# EasyEDA Pro project StepMother1_EasyEDA-Pro-V2_2026-11-01.epro

# Schematic Schematic1
Board Name: Board1; Create Date: 2026-08-29; Page Name: P1; Project Name: Step Sequencer; Schematic Name: Schematic1; Update Date: 2026-08-29; Company: EasyEDA.com; Page Size: A4; Version: V1.0
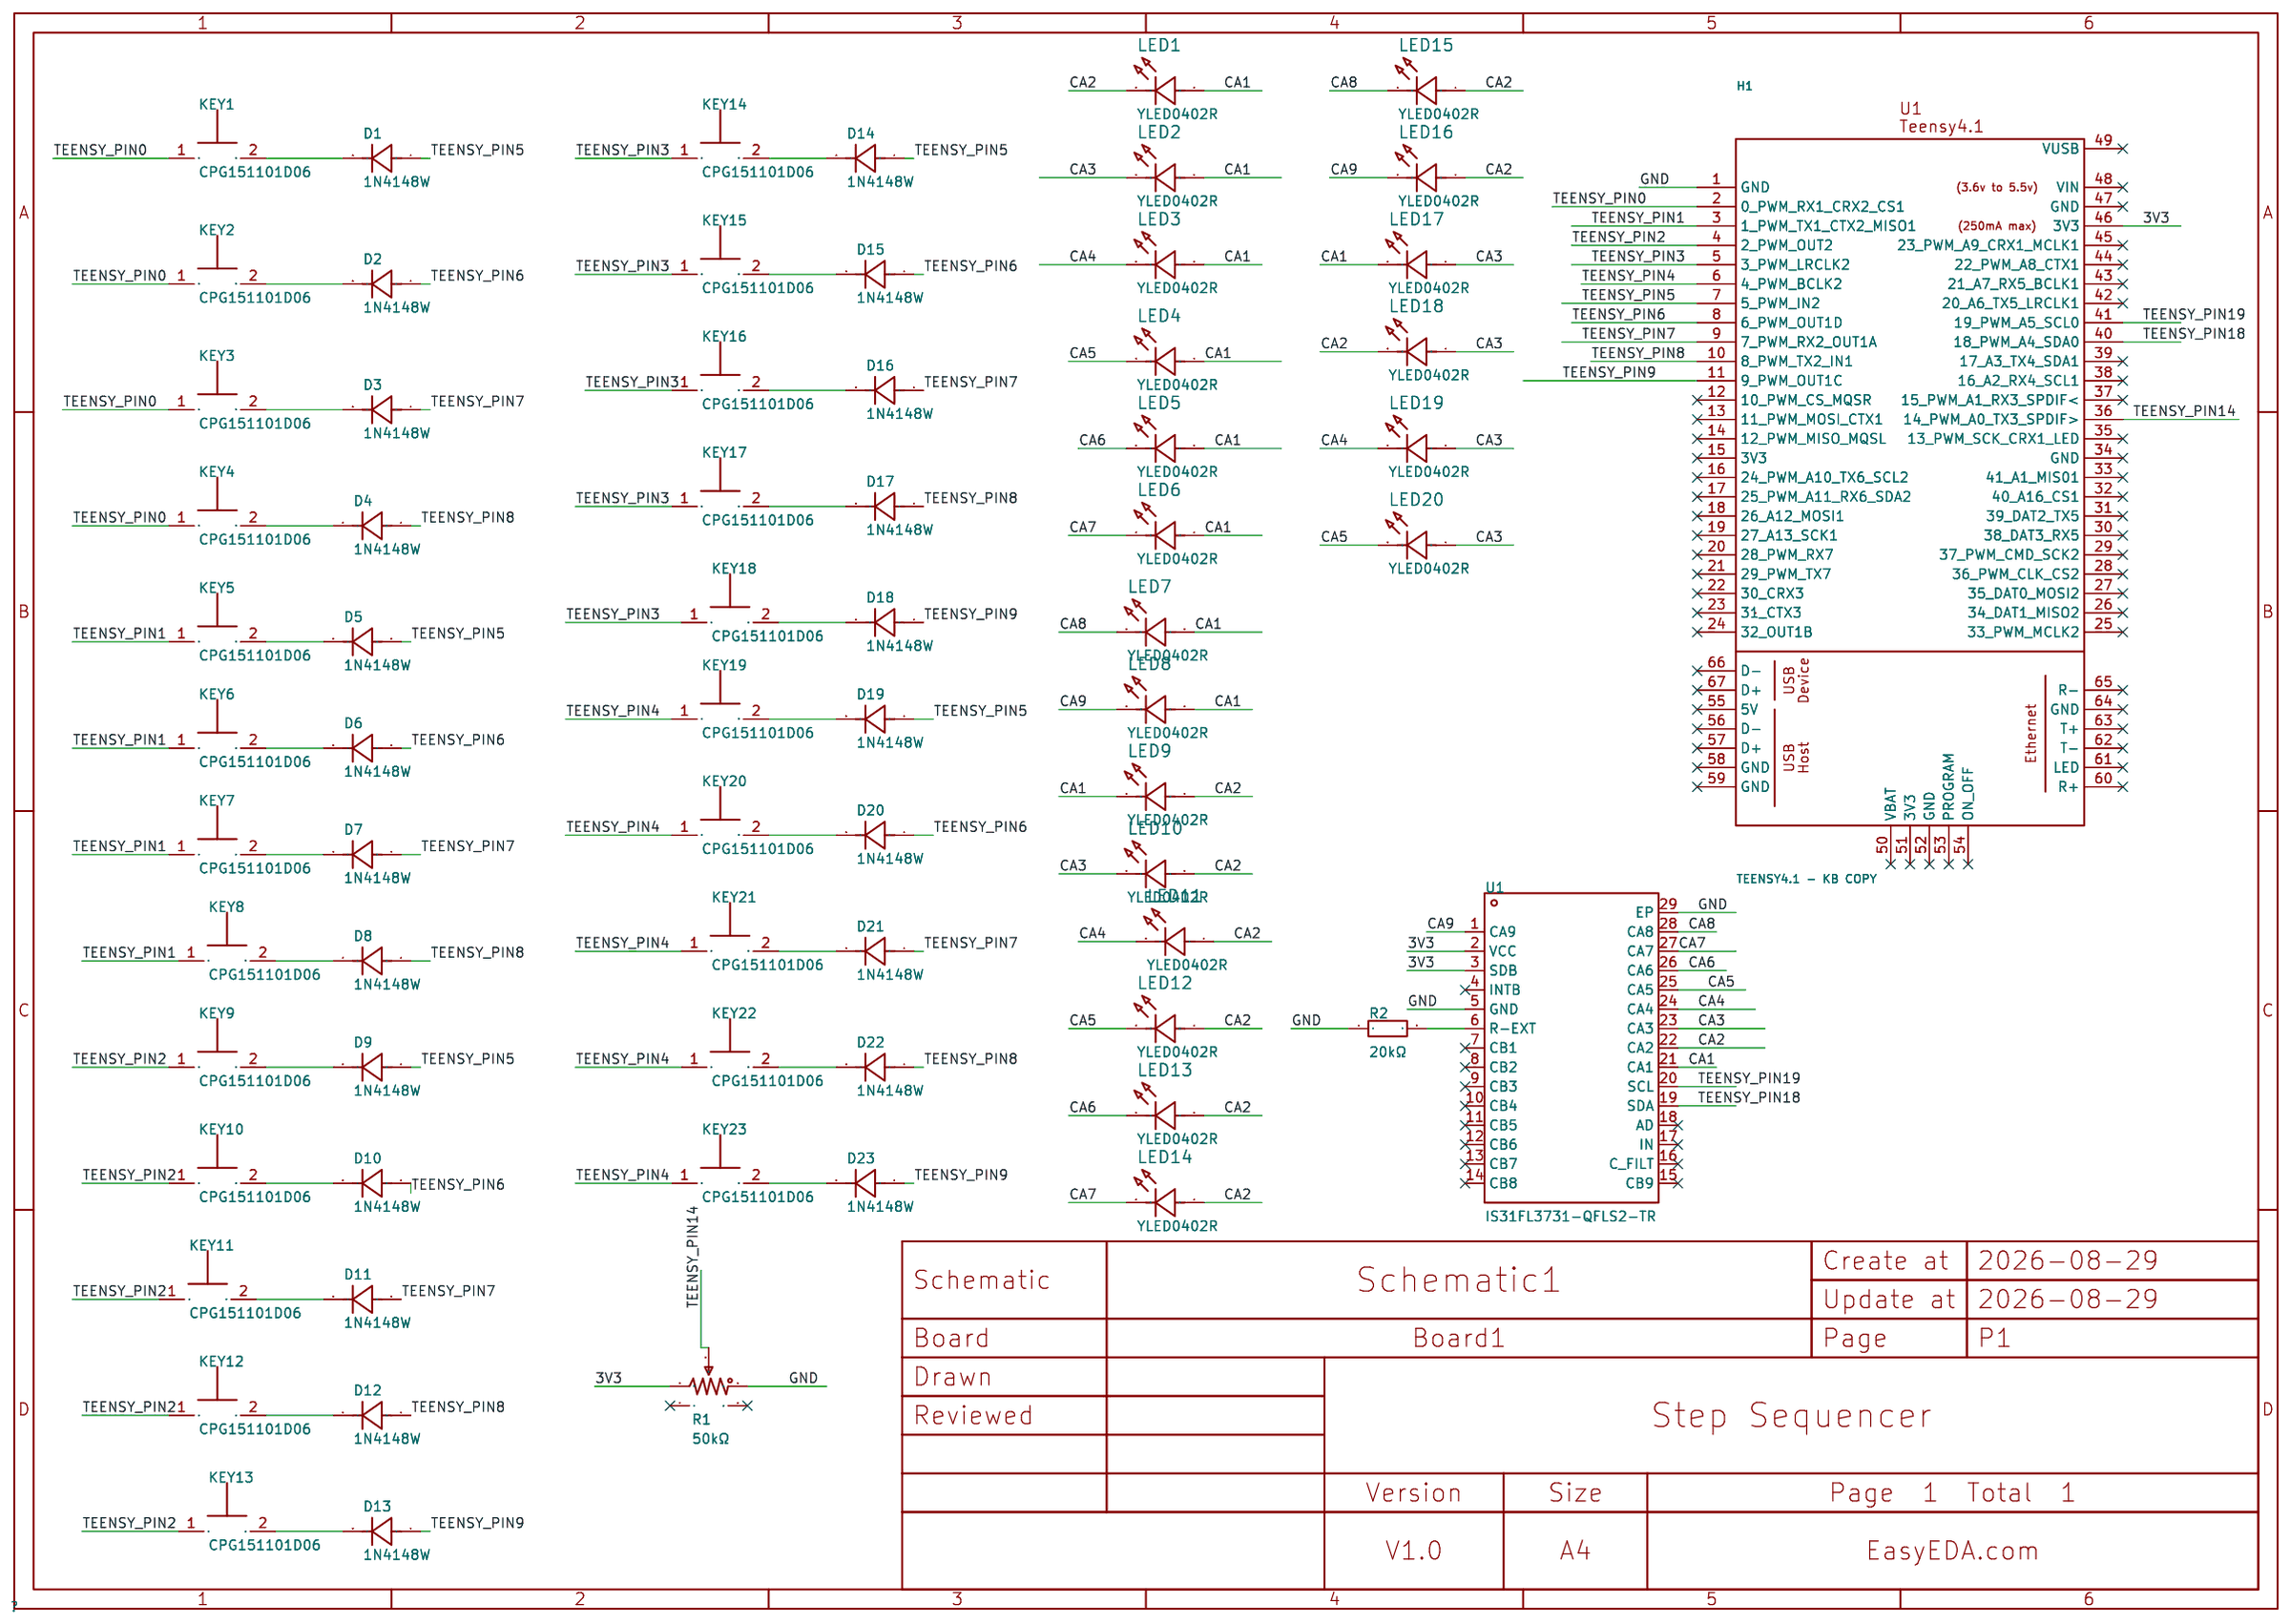
[diagram p0: schematic sheet]

## Parts
D1  1N4148W  [SOD-123_L2.7-W1.6-LS3.7-FD]
D2  1N4148W  [SOD-123_L2.7-W1.6-LS3.7-FD]
D3  1N4148W  [SOD-123_L2.7-W1.6-LS3.7-FD]
D4  1N4148W  [SOD-123_L2.7-W1.6-LS3.7-FD]
D5  1N4148W  [SOD-123_L2.7-W1.6-LS3.7-FD]
D6  1N4148W  [SOD-123_L2.7-W1.6-LS3.7-FD]
D7  1N4148W  [SOD-123_L2.7-W1.6-LS3.7-FD]
D8  1N4148W  [SOD-123_L2.7-W1.6-LS3.7-FD]
D9  1N4148W  [SOD-123_L2.7-W1.6-LS3.7-FD]
D10  1N4148W  [SOD-123_L2.7-W1.6-LS3.7-FD]
D11  1N4148W  [SOD-123_L2.7-W1.6-LS3.7-FD]
D12  1N4148W  [SOD-123_L2.7-W1.6-LS3.7-FD]
D13  1N4148W  [SOD-123_L2.7-W1.6-LS3.7-FD]
D14  1N4148W  [SOD-123_L2.7-W1.6-LS3.7-FD]
D15  1N4148W  [SOD-123_L2.7-W1.6-LS3.7-FD]
D16  1N4148W  [SOD-123_L2.7-W1.6-LS3.7-FD]
D17  1N4148W  [SOD-123_L2.7-W1.6-LS3.7-FD]
D18  1N4148W  [SOD-123_L2.7-W1.6-LS3.7-FD]
D19  1N4148W  [SOD-123_L2.7-W1.6-LS3.7-FD]
D20  1N4148W  [SOD-123_L2.7-W1.6-LS3.7-FD]
D21  1N4148W  [SOD-123_L2.7-W1.6-LS3.7-FD]
D22  1N4148W  [SOD-123_L2.7-W1.6-LS3.7-FD]
D23  1N4148W  [SOD-123_L2.7-W1.6-LS3.7-FD]
H1  Teensy 4.1  [TEENSY4.1 - KB]
KEY1  CPG151101D06  [KEY-TH_CPG151101D06]
KEY2  CPG151101D06  [KEY-TH_CPG151101D06]
KEY3  CPG151101D06  [KEY-TH_CPG151101D06]
KEY4  CPG151101D06  [KEY-TH_CPG151101D06]
KEY5  CPG151101D06  [KEY-TH_CPG151101D06]
KEY6  CPG151101D06  [KEY-TH_CPG151101D06]
KEY7  CPG151101D06  [KEY-TH_CPG151101D06]
KEY8  CPG151101D06  [KEY-TH_CPG151101D06]
KEY9  CPG151101D06  [KEY-TH_CPG151101D06]
KEY10  CPG151101D06  [KEY-TH_CPG151101D06]
KEY11  CPG151101D06  [KEY-TH_CPG151101D06]
KEY12  CPG151101D06  [KEY-TH_CPG151101D06]
KEY13  CPG151101D06  [KEY-TH_CPG151101D06]
KEY14  CPG151101D06  [KEY-TH_CPG151101D06]
KEY15  CPG151101D06  [KEY-TH_CPG151101D06]
KEY16  CPG151101D06  [KEY-TH_CPG151101D06]
KEY17  CPG151101D06  [KEY-TH_CPG151101D06]
KEY18  CPG151101D06  [KEY-TH_CPG151101D06]
KEY19  CPG151101D06  [KEY-TH_CPG151101D06]
KEY20  CPG151101D06  [KEY-TH_CPG151101D06]
KEY21  CPG151101D06  [KEY-TH_CPG151101D06]
KEY22  CPG151101D06  [KEY-TH_CPG151101D06]
KEY23  CPG151101D06  [KEY-TH_CPG151101D06]
LED1  YLED0402R  [LED0402-R-RD]
LED2  YLED0402R  [LED0402-R-RD]
LED3  YLED0402R  [LED0402-R-RD]
LED4  YLED0402R  [LED0402-R-RD]
LED5  YLED0402R  [LED0402-R-RD]
LED6  YLED0402R  [LED0402-R-RD]
LED7  YLED0402R  [LED0402-R-RD]
LED8  YLED0402R  [LED0402-R-RD]
LED9  YLED0402R  [LED0402-R-RD]
LED10  YLED0402R  [LED0402-R-RD]
LED11  YLED0402R  [LED0402-R-RD]
LED12  YLED0402R  [LED0402-R-RD]
LED13  YLED0402R  [LED0402-R-RD]
LED14  YLED0402R  [LED0402-R-RD]
LED15  YLED0402R  [LED0402-R-RD]
LED16  YLED0402R  [LED0402-R-RD]
LED17  YLED0402R  [LED0402-R-RD]
LED18  YLED0402R  [LED0402-R-RD]
LED19  YLED0402R  [LED0402-R-RD]
LED20  YLED0402R  [LED0402-R-RD]
R1  50kΩ  [RES-ADJ-TH_RK09L1140A5P]
R2  20kΩ  [R0603]
U1  IS31FL3731-QFLS2-TR  [QFN-28_L4.0-W4.0-P0.40-BL-EP]

## Library data of the parts
D1-D23 = 1N4148W_C5345962: Diode Configuration:Standalone Pd - Power Dissipation:350mW Current - Rectified:150mA Voltage - DC Reverse(Vr):100V Voltage - Forward(Vf@If):1.25V@150mA Non-Repetitive Peak Forward Surge Current:2A Reverse Leakage Current (Ir):1uA@75V Reverse Recovery Tim; LCSC Part Name: 100V 150mA; Supplier Part: C5345962; Manufacturer: HXY MOSFET(华轩阳电子); Supplier Footprint: SOD-123; JLCPCB Part Class: Extended Part; Datasheet: https://item.szlcsc.com/datasheet/1N4148W/6125799.html; Supplier: LCSC; Diode Configuration: Standalone; Pd - Power Dissipation: 350mW; Current - Rectified: 150mA; Voltage - DC Reverse(Vr): 100V; Voltage - Forward(Vf@If): 1.25V@150mA; Non-Repetitive Peak Forward Surge Current: 2A; Reverse Leakage Current (Ir): 1uA@75V; Reverse Recovery Time (trr): 4ns; Operating Junction Temperature Range: -55℃~+150℃
H1 = TEENSY4.1 - KB COPY: Manufacturer: PJRC; Manufacturer Part: Teensy4.1; link: https://www.pjrc.com/store/teensy41.html
KEY1-KEY23 = CPG151101D06: Axis Type:Brown Switch Operation Force:45gf Conduction Travel:2mm Voltage Rating:12V Operating Temperature:-40℃~+70℃ Operating Temperature:-40℃~+70℃; LCSC Part Name: 茶轴; Supplier Part: C49234237; Manufacturer: HanElectricity(瀚源); Supplier Footprint: 插件; JLCPCB Part Class: Extended Part; Datasheet: https://item.szlcsc.com/datasheet/CPG151101D06/51650379.html; Supplier: LCSC; Axis Type: Brown Switch; Operation Force: 45gf; Conduction Travel: 2mm; Voltage Rating: 12V; Operating Temperature: -40℃~+70℃
LED1-LED20 = YLED0402R: Lamp Holder Type:- Illumination Color:Red Voltage - Forward(Vf):1.8V~2.4V Voltage - Forward(Vf):1.8V~2.4V Power(Watts):60mW Forward Current:20mA Wavelength - Dominant:615nm~630nm Wavelength - Dominant:615nm~630nm Peak Wavelength:645nm Peak Wavelength:645n; LCSC Part Name: 发光管; Supplier Part: C21260817; Manufacturer: YONGYUTAI(永裕泰); Supplier Footprint: 0402; JLCPCB Part Class: Extended Part; Datasheet: https://item.szlcsc.com/datasheet/YLED0402R/22678288.html; Supplier: LCSC; Illumination Color: Red; Voltage - Forward(Vf): 1.8V~2.4V; Power(Watts): 60mW; Forward Current: 20mA; Wavelength - Dominant: 615nm~630nm; Peak Wavelength: 645nm; Diode Configuration: Discrete Diode; Lens Color: Water Clear; Luminous Intensity: 250mcd; Viewing Angle: 120°; Operating Temperature: -40℃~+85℃
R1 = RK09L1140A5P: Resistance:50kΩ Tolerance:±20% Tolerance:±20% Voltage Rating:10V Power(Watts):50mW; LCSC Part Name: 三件套 50kΩ ±20%; Supplier Part: C231764; Manufacturer: ALPSALPINE(阿尔卑斯阿尔派); Supplier Footprint: 插件; JLCPCB Part Class: Extended Part; Datasheet: https://item.szlcsc.com/datasheet/RK09L1140A5P/231612.html; Supplier: LCSC; Tolerance: ±20%; Voltage Rating: 10V; Power(Watts): 50mW
R2 = 0603WAF2002T5E: Type:Thick Film Resistor Resistance:20kΩ Tolerance:±1% Tolerance:±1% Power(Watts):100mW Voltage-Supply(Max):75V Temperature Coefficient:±100ppm/℃ Temperature Coefficient:±100ppm/℃ Operating Temperature:-55℃~+155℃ Operating Temperature:-55℃~+155℃; LCSC Part Name: 厚膜电阻 20kΩ ±1%; Supplier Part: C4184; Manufacturer: UNI-ROYAL(厚声); Supplier Footprint: 0603; JLCPCB Part Class: Basic Part; Datasheet: https://item.szlcsc.com/datasheet/0603WAF2002T5E/4591.html; Supplier: LCSC; Type: Thick Film Resistor; Tolerance: ±1%; Power(Watts): 100mW; Voltage-Supply(Max): 75V; Temperature Coefficient: ±100ppm/℃; Operating Temperature: -55℃~+155℃
U1 = IS31FL3731-QFLS2-TR: LCSC Part Name: 音频调制矩阵LED驱动器; Supplier Part: C191206; Manufacturer: ISSI(美国芯成); Supplier Footprint: QFN-28-EP(4x4); JLCPCB Part Class: Extended Part; Datasheet: https://item.szlcsc.com/datasheet/IS31FL3731-QFLS2-TR/214396.html; Supplier: LCSC

## Nets
3V3: H1.46(3V3) R1.3 U1.2(VCC) U1.3(SDB)
GND: H1.1(GND) R1.1 R2.1 U1.5(GND) U1.29(EP)
CA1: LED1.1(A) LED2.1(A) LED3.1(A) LED4.1(A) LED5.1(A) LED6.1(A) LED7.1(A) LED8.1(A) LED9.2(K) LED17.2(K) U1.21(CA1)
CA2: LED1.2(K) LED9.1(A) LED10.1(A) LED11.1(A) LED12.1(A) LED13.1(A) LED14.1(A) LED15.1(A) LED16.1(A) LED18.2(K) U1.22(CA2)
CA3: LED2.2(K) LED10.2(K) LED17.1(A) LED18.1(A) LED19.1(A) LED20.1(A) U1.23(CA3)
CA4: LED3.2(K) LED11.2(K) LED19.2(K) U1.24(CA4)
CA5: LED4.2(K) LED12.2(K) LED20.2(K) U1.25(CA5)
CA6: LED5.2(K) LED13.2(K) U1.26(CA6)
CA7: LED6.2(K) LED14.2(K) U1.27(CA7)
CA8: LED7.2(K) LED15.2(K) U1.28(CA8)
CA9: LED8.2(K) LED16.2(K) U1.1(CA9)
TEENSY_PIN0: H1.2(0_PWM_RX1_CRX2_CS1) KEY1.1 KEY2.1 KEY3.1 KEY4.1
TEENSY_PIN1: H1.3(1_PWM_TX1_CTX2_MISO1) KEY5.1 KEY6.1 KEY7.1 KEY8.1
TEENSY_PIN2: H1.4(2_PWM_OUT2) KEY9.1 KEY10.1 KEY11.1 KEY12.1 KEY13.1
TEENSY_PIN3: H1.5(3_PWM_LRCLK2) KEY14.1 KEY15.1 KEY16.1 KEY17.1 KEY18.1
TEENSY_PIN4: H1.6(4_PWM_BCLK2) KEY19.1 KEY20.1 KEY21.1 KEY22.1 KEY23.1
TEENSY_PIN5: D1.1(+) D5.1(+) D9.1(+) D14.1(+) D19.1(+) H1.7(5_PWM_IN2)
TEENSY_PIN6: D2.1(+) D6.1(+) D10.1(+) D15.1(+) D20.1(+) H1.8(6_PWM_OUT1D)
TEENSY_PIN7: D3.1(+) D7.1(+) D11.1(+) D16.1(+) D21.1(+) H1.9(7_PWM_RX2_OUT1A)
TEENSY_PIN8: D4.1(+) D8.1(+) D12.1(+) D17.1(+) D22.1(+) H1.10(8_PWM_TX2_IN1)
TEENSY_PIN9: D13.1(+) D18.1(+) D23.1(+) H1.11(9_PWM_OUT1C)
TEENSY_PIN14: H1.36(14_PWM_A0_TX3_SPDIF>) R1.2
TEENSY_PIN18: H1.40(18_PWM_A4_SDA0) U1.19(SDA)
TEENSY_PIN19: H1.41(19_PWM_A5_SCL0) U1.20(SCL)
$1N4: D1.2(-) KEY1.2
$1N5: D2.2(-) KEY2.2
$1N7: D3.2(-) KEY3.2
$1N9: D4.2(-) KEY4.2
$1N13: D5.2(-) KEY5.2
$1N15: D6.2(-) KEY6.2
$1N17: D7.2(-) KEY7.2
$1N19: D8.2(-) KEY8.2
$1N21: D9.2(-) KEY9.2
$1N23: D10.2(-) KEY10.2
$1N25: D11.2(-) KEY11.2
$1N27: D12.2(-) KEY12.2
$1N29: D13.2(-) KEY13.2
$1N31: D14.2(-) KEY14.2
$1N33: D15.2(-) KEY15.2
$1N35: D16.2(-) KEY16.2
$1N37: D17.2(-) KEY17.2
$1N39: D18.2(-) KEY18.2
$1N41: D19.2(-) KEY19.2
$1N43: D20.2(-) KEY20.2
$1N45: D21.2(-) KEY21.2
$1N47: D22.2(-) KEY22.2
$1N49: D23.2(-) KEY23.2
$1N106: R2.2 U1.6(R-EXT)

Not connected (* = marked no-connect by the designer): H1 12(10_PWM_CS_MQSR)* 13(11_PWM_MOSI_CTX1)* 14(12_PWM_MISO_MQSL)* 15(3V3)* 16(24_PWM_A10_TX6_SCL2)* 17(25_PWM_A11_RX6_SDA2)* 18(26_A12_MOSI1)* 19(27_A13_SCK1)* 20(28_PWM_RX7)* 21(29_PWM_TX7)* 22(30_CRX3)* 23(31_CTX3)* 24(32_OUT1B)* 25(33_PWM_MCLK2)* 26(34_DAT1_MISO2)* 27(35_DAT0_MOSI2)* 28(36_PWM_CLK_CS2)* 29(37_PWM_CMD_SCK2)* 30(38_DAT3_RX5)* 31(39_DAT2_TX5)* 32(40_A16_CS1)* 33(41_A1_MIS01)* 34(GND)* 35(13_PWM_SCK_CRX1_LED)* 37(15_PWM_A1_RX3_SPDIF<)* 38(16_A2_RX4_SCL1)* 39(17_A3_TX4_SDA1)* 42(20_A6_TX5_LRCLK1)* 43(21_A7_RX5_BCLK1)* 44(22_PWM_A8_CTX1)* 45(23_PWM_A9_CRX1_MCLK1)* 47(GND)* 48(VIN)* 49(VUSB)* 50(VBAT)* 51(3V3)* 52(GND)* 53(PROGRAM)* 54(ON_OFF)* 55(5V)* 56(D-)* 57(D+)* 58(GND)* 59(GND)* 60(R+)* 61(LED)* 62(T-)* 63(T+)* 64(GND)* 65(R-)* 66(D-)* 67(D+)*; R1 4* 5*; U1 4(INTB)* 7(CB1)* 8(CB2)* 9(CB3)* 10(CB4)* 11(CB5)* 12(CB6)* 13(CB7)* 14(CB8)* 15(CB9)* 16(C_FILT)* 17(IN)* 18(AD)*

# Board PCB1
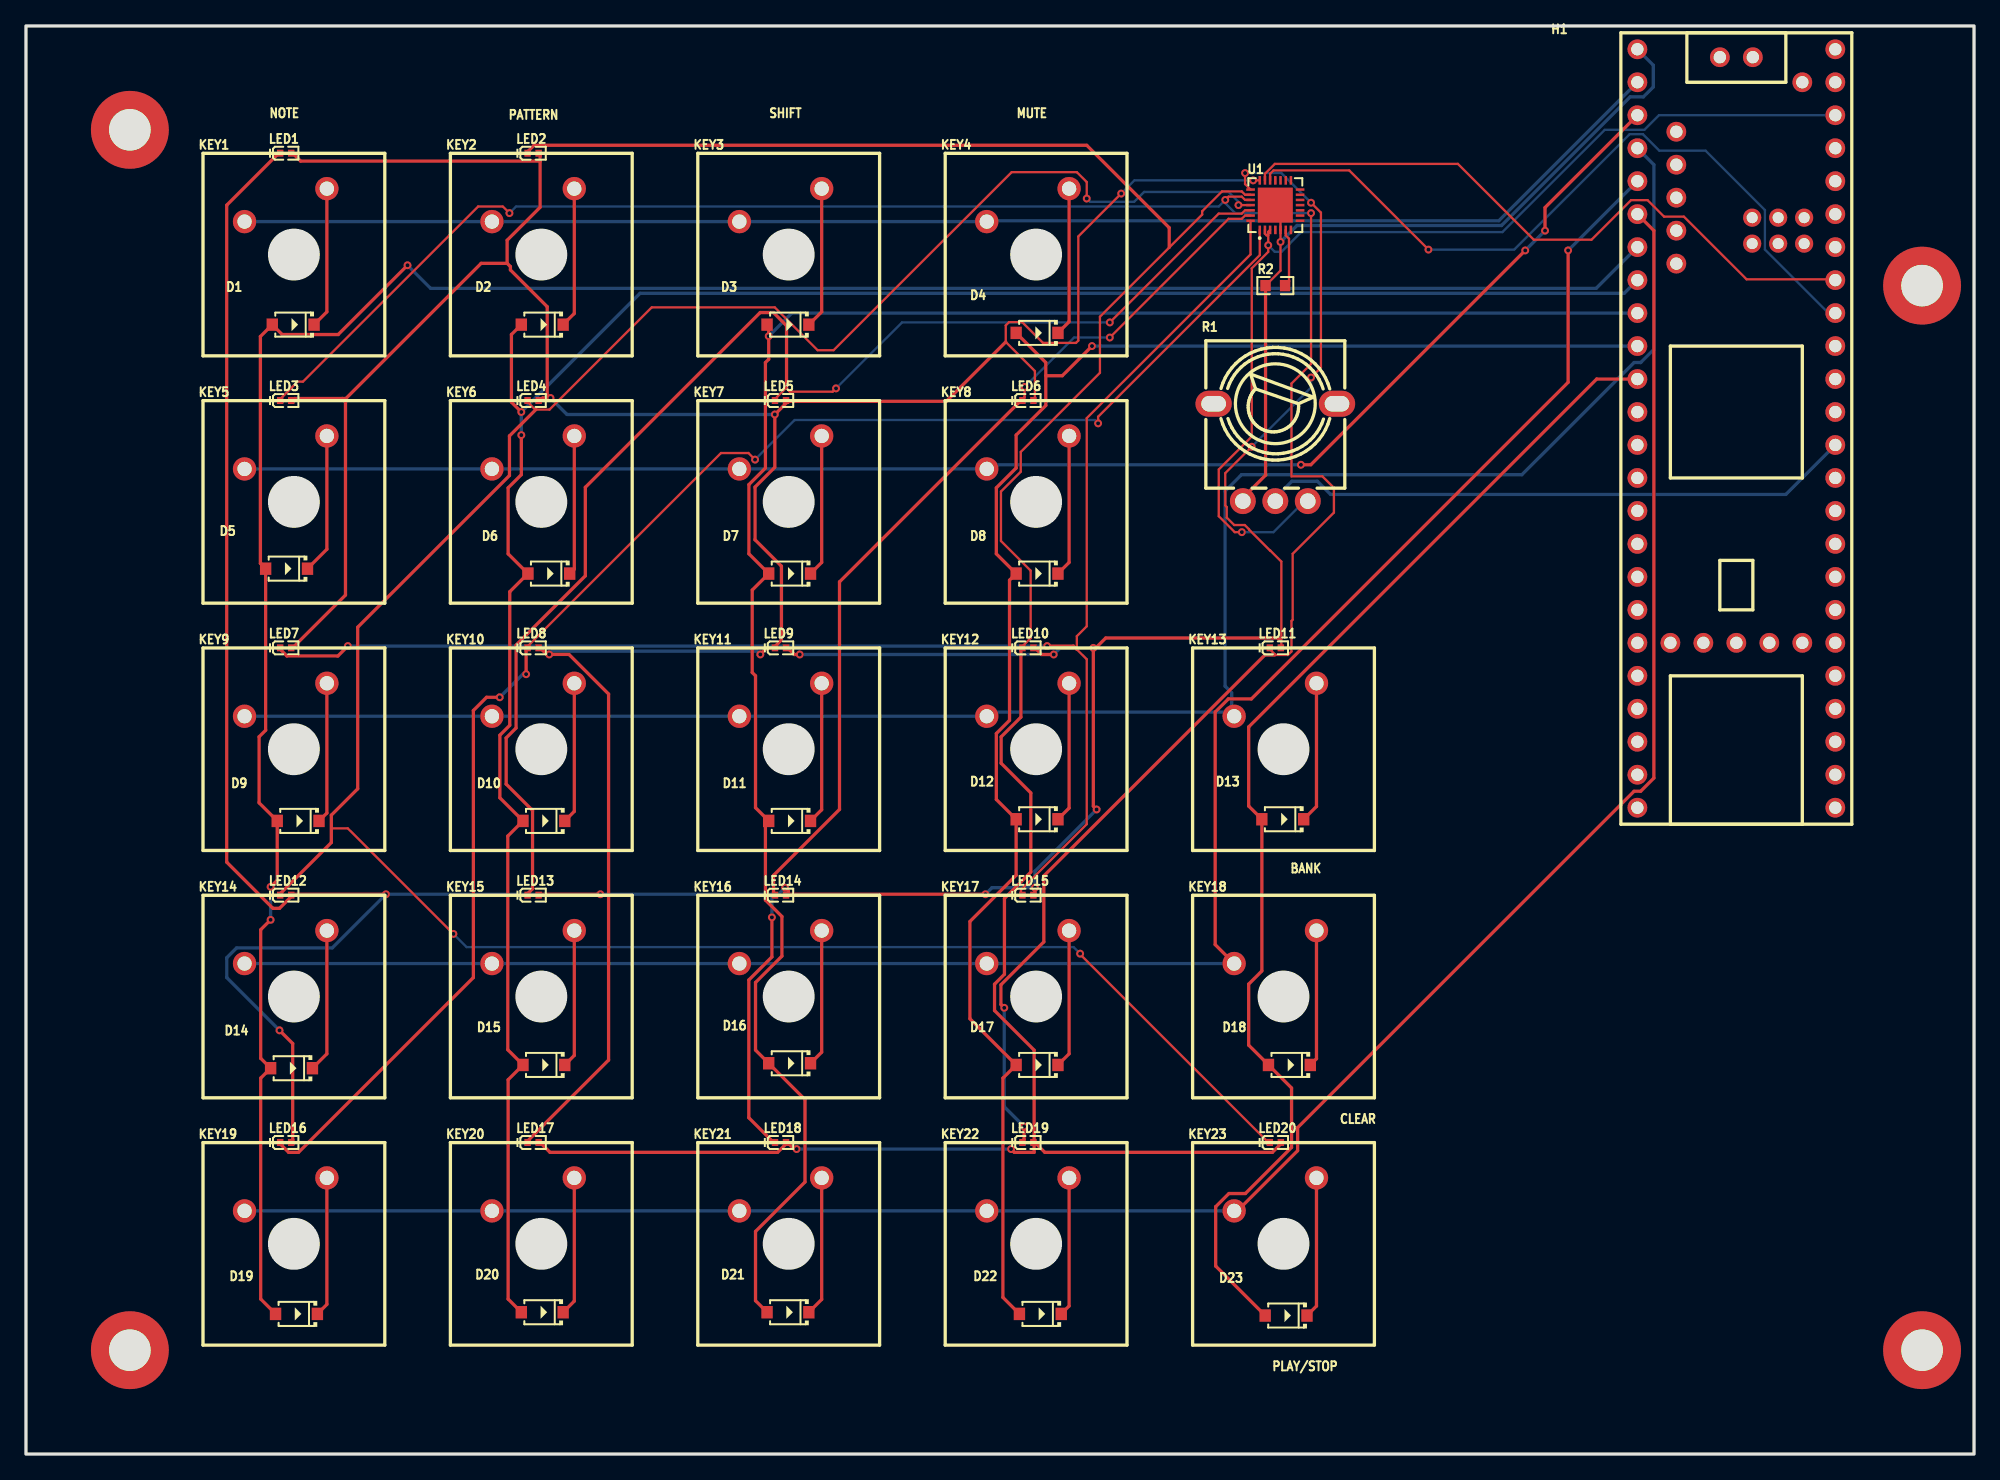
[diagram p1: board, top side]
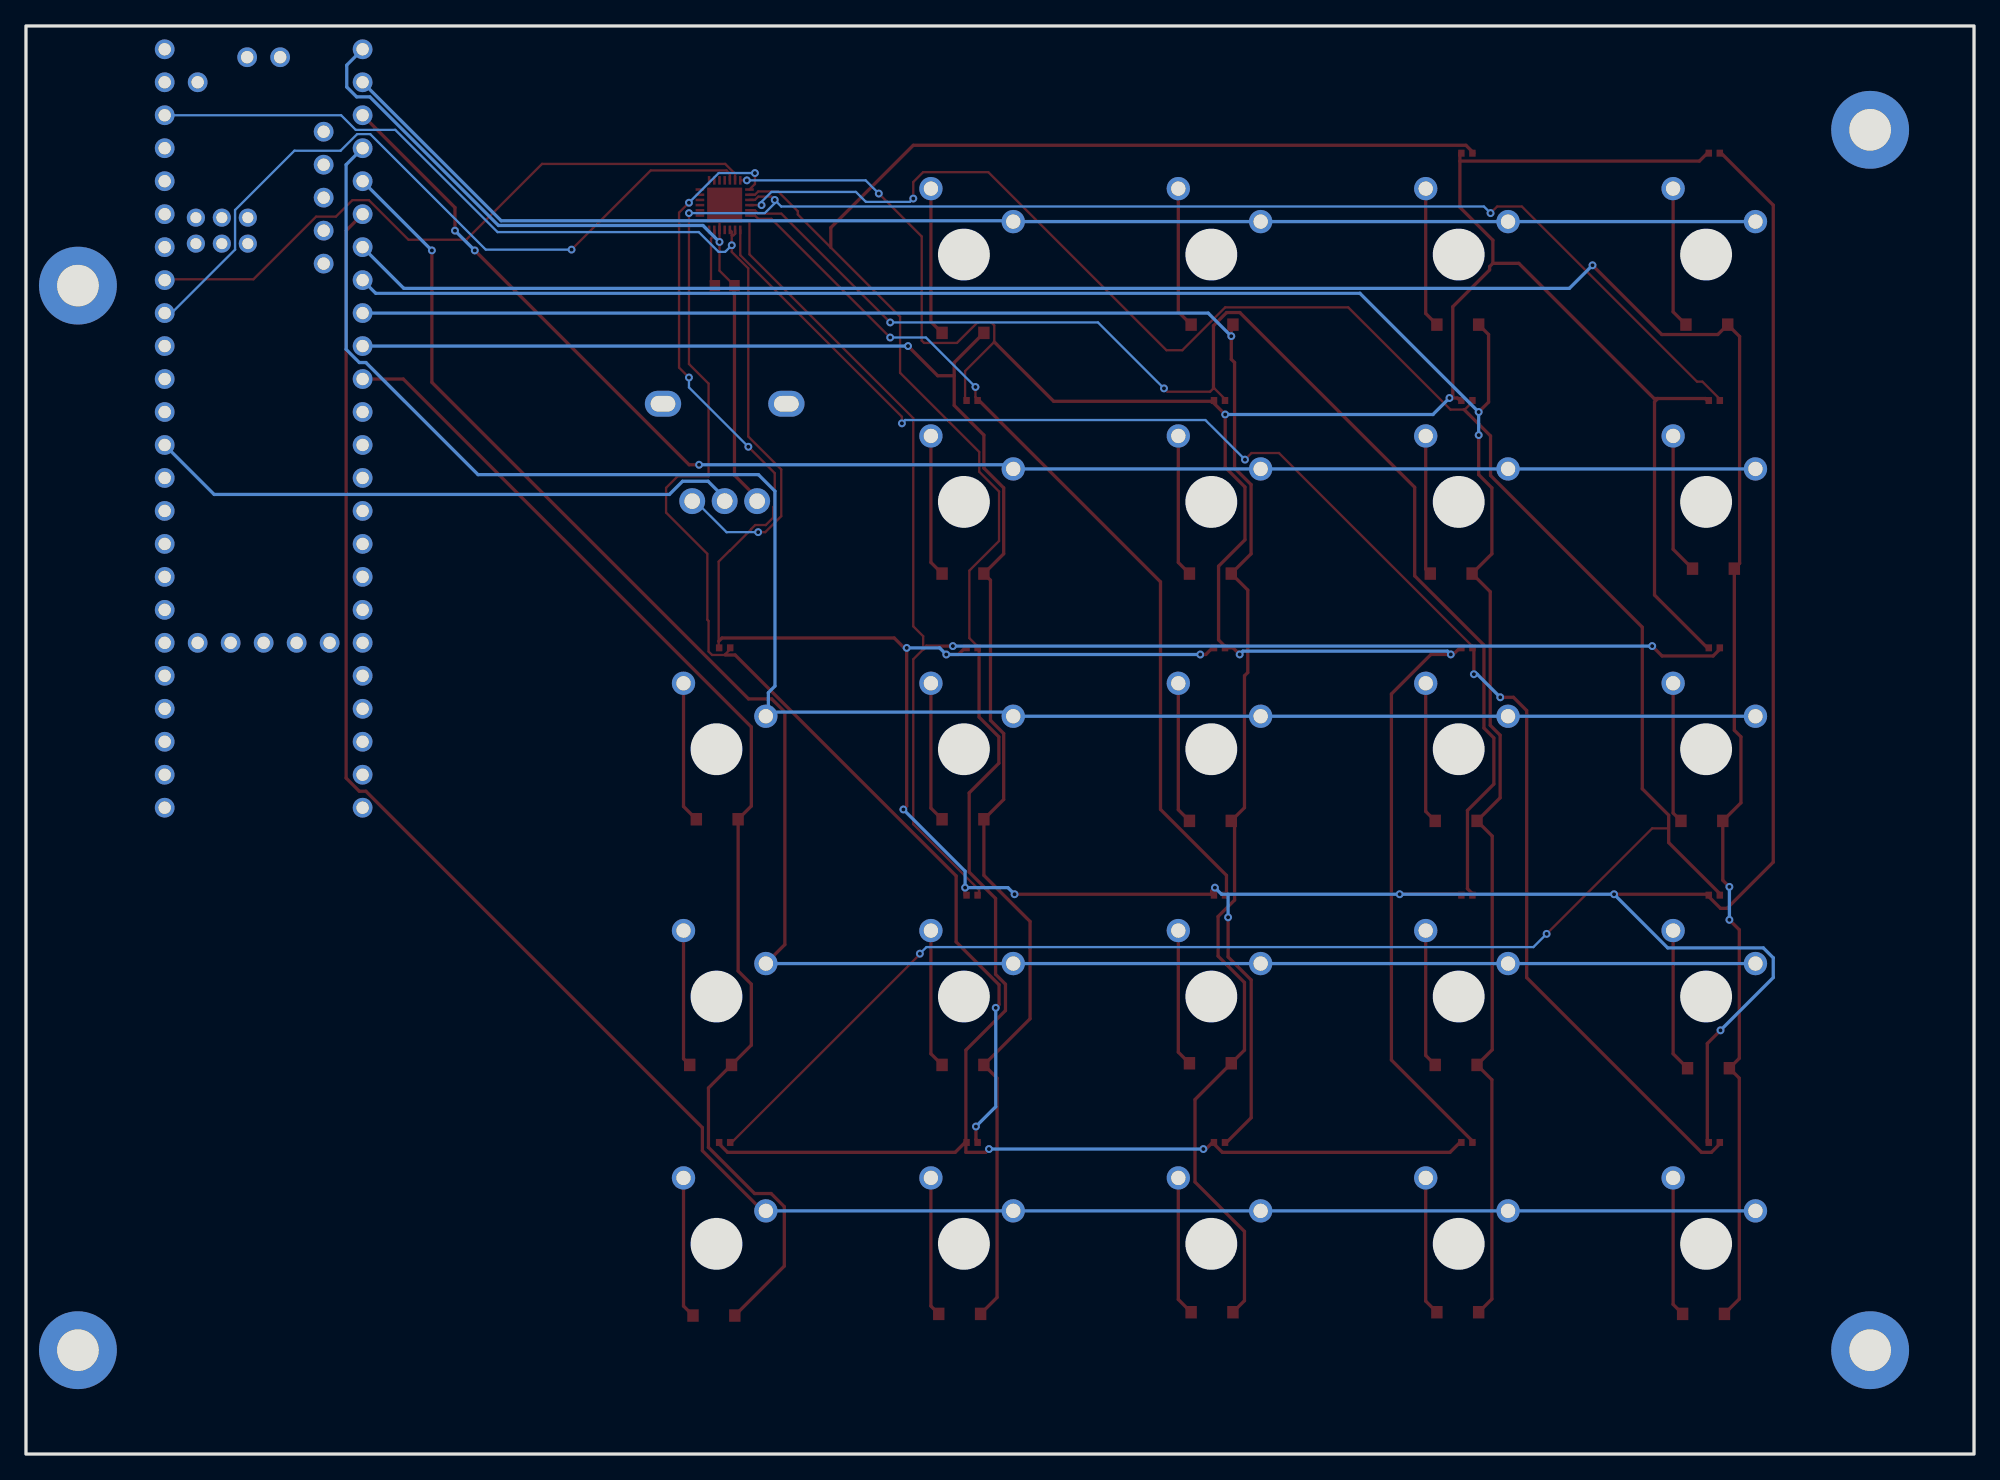
[diagram p2: board, bottom side, seen from below]

Outline 150 x 110 mm; copper layers: Top Layer, Bottom Layer. Coordinates in mm from the lower left corner of the outline.
Outline path: rectangle 0,110 150,0
Stack: Top Layer 0.035mm / Dielectric1 1.51mm FR4 er 4.5 / Bottom Layer 0.035mm

## Design rules (mm)
spacing copperThickness1oz (default): track to track 0.102, other pairs 0.152 to 0.3
spacing copperThickness2oz: track to track 0.203, other pairs 0.152 to 0.3
track width copperThickness1oz (default): min 0.127, default 0.254, max 2.54
track width copperThickness2oz: min 0.203, default 0.254, max 2.54
differential pair differentialPair (default): width min 0.127, default 0.254, max 2.54; gap min 0.152, default 0.152

## Placement (name value [footprint] x y rotation side)
D1  1N4148W  [SOD-123_L2.7-W1.6-LS3.7-FD]  20.57 87 0 top
D2  1N4148W  [SOD-123_L2.7-W1.6-LS3.7-FD]  39.75 87 0 top
D3  1N4148W  [SOD-123_L2.7-W1.6-LS3.7-FD]  58.67 87 0 top
D4  1N4148W  [SOD-123_L2.7-W1.6-LS3.7-FD]  77.85 86.36 0 top
D5  1N4148W  [SOD-123_L2.7-W1.6-LS3.7-FD]  20.07 68.2 0 top
D6  1N4148W  [SOD-123_L2.7-W1.6-LS3.7-FD]  40.26 67.82 0 top
D7  1N4148W  [SOD-123_L2.7-W1.6-LS3.7-FD]  58.8 67.82 0 top
D8  1N4148W  [SOD-123_L2.7-W1.6-LS3.7-FD]  77.85 67.82 0 top
D9  1N4148W  [SOD-123_L2.7-W1.6-LS3.7-FD]  20.95 48.77 0 top
D10  1N4148W  [SOD-123_L2.7-W1.6-LS3.7-FD]  39.88 48.77 0 top
D11  1N4148W  [SOD-123_L2.7-W1.6-LS3.7-FD]  58.8 48.77 0 top
D12  1N4148W  [SOD-123_L2.7-W1.6-LS3.7-FD]  77.85 48.89 0 top
D13  1N4148W  [SOD-123_L2.7-W1.6-LS3.7-FD]  96.77 48.89 0 top
D14  1N4148W  [SOD-123_L2.7-W1.6-LS3.7-FD]  20.45 29.72 0 top
D15  1N4148W  [SOD-123_L2.7-W1.6-LS3.7-FD]  39.88 29.97 0 top
D16  1N4148W  [SOD-123_L2.7-W1.6-LS3.7-FD]  58.8 30.1 0 top
D17  1N4148W  [SOD-123_L2.7-W1.6-LS3.7-FD]  77.85 29.97 0 top
D18  1N4148W  [SOD-123_L2.7-W1.6-LS3.7-FD]  97.28 29.97 0 top
D19  1N4148W  [SOD-123_L2.7-W1.6-LS3.7-FD]  20.83 10.79 0 top
D20  1N4148W  [SOD-123_L2.7-W1.6-LS3.7-FD]  39.75 10.92 0 top
D21  1N4148W  [SOD-123_L2.7-W1.6-LS3.7-FD]  58.67 10.92 0 top
D22  1N4148W  [SOD-123_L2.7-W1.6-LS3.7-FD]  78.1 10.79 0 top
D23  1N4148W  [SOD-123_L2.7-W1.6-LS3.7-FD]  97.03 10.67 0 top
H1  Teensy 4.1  [TEENSY4.1 - KB]  122.81 109.35 0 top
KEY1  CPG151101D06  [KEY-TH_CPG151101D06]  20 96.2 0 top
KEY2  CPG151101D06  [KEY-TH_CPG151101D06]  39.05 96.2 0 top
KEY3  CPG151101D06  [KEY-TH_CPG151101D06]  58.1 96.2 0 top
KEY4  CPG151101D06  [KEY-TH_CPG151101D06]  77.15 96.2 0 top
KEY5  CPG151101D06  [KEY-TH_CPG151101D06]  20 77.15 0 top
KEY6  CPG151101D06  [KEY-TH_CPG151101D06]  39.05 77.15 0 top
KEY7  CPG151101D06  [KEY-TH_CPG151101D06]  58.1 77.15 0 top
KEY8  CPG151101D06  [KEY-TH_CPG151101D06]  77.15 77.15 0 top
KEY9  CPG151101D06  [KEY-TH_CPG151101D06]  20 58.1 0 top
KEY10  CPG151101D06  [KEY-TH_CPG151101D06]  39.05 58.1 0 top
KEY11  CPG151101D06  [KEY-TH_CPG151101D06]  58.1 58.1 0 top
KEY12  CPG151101D06  [KEY-TH_CPG151101D06]  77.15 58.1 0 top
KEY13  CPG151101D06  [KEY-TH_CPG151101D06]  96.2 58.1 0 top
KEY14  CPG151101D06  [KEY-TH_CPG151101D06]  20 39.05 0 top
KEY15  CPG151101D06  [KEY-TH_CPG151101D06]  39.05 39.05 0 top
KEY16  CPG151101D06  [KEY-TH_CPG151101D06]  58.1 39.05 0 top
KEY17  CPG151101D06  [KEY-TH_CPG151101D06]  77.15 39.05 0 top
KEY18  CPG151101D06  [KEY-TH_CPG151101D06]  96.2 39.05 0 top
KEY19  CPG151101D06  [KEY-TH_CPG151101D06]  20 20 0 top
KEY20  CPG151101D06  [KEY-TH_CPG151101D06]  39.05 20 0 top
KEY21  CPG151101D06  [KEY-TH_CPG151101D06]  58.1 20 0 top
KEY22  CPG151101D06  [KEY-TH_CPG151101D06]  77.15 20 0 top
KEY23  CPG151101D06  [KEY-TH_CPG151101D06]  96.2 20 0 top
LED1  YLED0402R  [LED0402-R-RD]  20 100.2 0 top
LED2  YLED0402R  [LED0402-R-RD]  39.05 100.2 0 top
LED3  YLED0402R  [LED0402-R-RD]  20 81.15 0 top
LED4  YLED0402R  [LED0402-R-RD]  39.05 81.15 0 top
LED5  YLED0402R  [LED0402-R-RD]  58.1 81.15 0 top
LED6  YLED0402R  [LED0402-R-RD]  77.15 81.15 0 top
LED7  YLED0402R  [LED0402-R-RD]  20 62.1 0 top
LED8  YLED0402R  [LED0402-R-RD]  39.05 62.1 0 top
LED9  YLED0402R  [LED0402-R-RD]  58.1 62.1 0 top
LED10  YLED0402R  [LED0402-R-RD]  77.15 62.1 0 top
LED11  YLED0402R  [LED0402-R-RD]  96.2 62.1 0 top
LED12  YLED0402R  [LED0402-R-RD]  20 43.05 0 top
LED13  YLED0402R  [LED0402-R-RD]  39.05 43.05 0 top
LED14  YLED0402R  [LED0402-R-RD]  58.1 43.05 0 top
LED15  YLED0402R  [LED0402-R-RD]  77.15 43.05 0 top
LED16  YLED0402R  [LED0402-R-RD]  20 24 0 top
LED17  YLED0402R  [LED0402-R-RD]  39.05 24 0 top
LED18  YLED0402R  [LED0402-R-RD]  58.1 24 0 top
LED19  YLED0402R  [LED0402-R-RD]  77.15 24 0 top
LED20  YLED0402R  [LED0402-R-RD]  96.2 24 0 top
NOREF  -  [Pad_e298]  8 8 0 top
NOREF#2  -  [Pad_e300]  8 102 0 top
NOREF#3  -  [Pad_e299]  146 8 0 top
NOREF#4  -  [Pad_e301]  146 90 0 top
R1  50kΩ  [RES-ADJ-TH_RK09L1140A5P]  96.2 77.15 0 top
R2  20kΩ  [R0603]  96.2 90 0 top
U1  IS31FL3731-QFLS2-TR  [QFN-28_L4.0-W4.0-P0.40-BL-EP]  96.2 96.2 0 top

## Footprints (pads in the part's own frame, mm; a bottom-side part is the same pattern mirrored in y, then rotated)
KEY-TH_CPG151101D06
  round 1.8 hole 1.1: 1(-3.17,-1.27) 2(3.17,1.27)
LED0402-R-RD
  rect 0.5x0.54 smd: 1(0.425,0) 2(-0.425,0)
Pad_e298
  round 6 hole 3.2: 1(0,0)
Pad_e299
  round 6 hole 3.2: 1(0,0)
Pad_e300
  round 6 hole 3.2: 2(0,0)
Pad_e301
  round 6 hole 3.2: 3(0,0)
QFN-28_L4.0-W4.0-P0.40-BL-EP
  rect 0.2x0.665 smd: 1(-1.2,-1.907) 2(-0.8,-1.907) 3(-0.4,-1.907) 4(0,-1.907) 5(0.4,-1.907) 6(0.8,-1.907) 7(1.2,-1.907) 15(1.2,1.907) 16(0.8,1.907) 17(0.4,1.907) 18(0,1.907) 19(-0.4,1.907) 20(-0.8,1.907) 21(-1.2,1.907)
  rect 0.665x0.2 smd: 8(1.907,-1.2) 9(1.907,-0.8) 10(1.907,-0.4) 11(1.907,0) 12(1.907,0.4) 13(1.907,0.8) 14(1.907,1.2) 22(-1.907,1.2) 23(-1.907,0.8) 24(-1.907,0.4) 25(-1.907,0) 26(-1.907,-0.4) 27(-1.907,-0.8) 28(-1.907,-1.2)
  rect 2.7x2.7 smd: 29(0,0)
R0603
  rect 0.806x0.864 smd: 1(-0.753,0) 2(0.753,0)
RES-ADJ-TH_RK09L1140A5P
  round 2 hole 1.2: 1(-2.5,-3.75) 2(0,-3.75) 3(2.5,-3.75)
  oval 2.8x2 hole 1.9x1.2: 4(4.75,3.75) 5(-4.75,3.75)
SOD-123_L2.7-W1.6-LS3.7-FD
  rect 0.88x0.96 smd: 1(-1.61,0) 2(1.61,0)
TEENSY4.1 - KB
  round 1.524 hole 0.95: 1(1.27,-1.143) 2(1.27,-3.683) 3(1.27,-6.223) 4(1.27,-8.763) 5(1.27,-11.303) 6(1.27,-13.843) 7(1.27,-16.383) 8(1.27,-18.923) 9(1.27,-21.463) 10(1.27,-24.003) 11(1.27,-26.543) 12(1.27,-29.083) 13(1.27,-31.623) 14(1.27,-34.163) 15(1.27,-36.703) 16(1.27,-39.243) 17(1.27,-41.783) 18(1.27,-44.323) 19(1.27,-46.863) 20(1.27,-49.403) 21(1.27,-51.943) 22(1.27,-54.483) 23(1.27,-57.023) 24(1.27,-59.563) 25(16.51,-59.563) 26(16.51,-57.023) 27(16.51,-54.483) 28(16.51,-51.943) 29(16.51,-49.403) 30(16.51,-46.863) 31(16.51,-44.323) 32(16.51,-41.783) 33(16.51,-39.243) 34(16.51,-36.703) 35(16.51,-34.163) 36(16.51,-31.623) 37(16.51,-29.083) 38(16.51,-26.543) 39(16.51,-24.003) 40(16.51,-21.463) 41(16.51,-18.923) 42(16.51,-16.383) 43(16.51,-13.843) 44(16.51,-11.303) 45(16.51,-8.763) 46(16.51,-6.223) 47(16.51,-3.683) 48(16.51,-1.143) 49(13.97,-3.683) 50(3.81,-46.863) 51(6.35,-46.863) 52(8.89,-46.863) 53(11.43,-46.863) 54(13.97,-46.863) 55(4.27,-7.493) 56(4.27,-10.033) 57(4.27,-12.573) 58(4.27,-15.113) 59(4.27,-17.653) 66(10.16,-1.753) 67(7.62,-1.753)
  round 1.4 hole 0.85: 60(14.11,-14.113) 61(12.11,-14.113) 62(10.11,-14.113) 63(10.11,-16.113) 64(12.11,-16.113) 65(14.11,-16.113)

## Nets
As in the schematic.

Pads without a net: H1 12 13 14 15 16 17 18 19 20 21 22 23 24 25 26 27 28 29 30 31 32 33 34 35 37 38 39 42 43 44 45 47 48 49 50 51 52 53 54 55 56 57 58 59 60 61 62 63 64 65 66 67; NOREF 1; NOREF#2 2; NOREF#3 1; NOREF#4 3; R1 4 5; U1 4 7 8 9 10 11 12 13 14 15 16 17 18

## Via types
v1: diameter 0.61, hole 0.305, Top Layer to Bottom Layer, 57 vias

## Routing (per net, layer and track width the routed paths; a pad name or vN(x,y) marks a point on that pad's centre or on a via; arc(x,y) is an arc through that point)
3V3: length 81
  Top Layer w0.18: 95.65,93.87 95.53,93.87 95.4,94 U1.2 ; 95.65,93.87 95.65,94.15 U1.3 ; 95.65,93.87 95.65,92.6 94.38,91.33 94.38,78.38 91.84,75.84 91.84,72.24 93.07,71.01 v1(93.62,71.01)
  Bottom Layer w0.18: 98.7,73.65 96.06,71.01 v1(93.62,71.01) ; H1.46 125.74,103.12 124.61,102 121.56,102 113.69,94.12 98.19,94.12 96.67,92.6 96.16,92.6 v1(95.65,93.11)
GND: length 61
  Top Layer w0.18: U1.29 96.6,95.8 U1.5 96.6,91.15 R2.1
  Top Layer w0.254: 93.7,73.65 95.45,75.4 R2.1
  Bottom Layer w0.254: H1.1 125.3,106.98 125.3,105.3 124.54,104.54 123.52,104.54 113.62,94.63 97.87,94.63 v1(96.6,93.36)
CA1: length 239.5
  Top Layer w0.18: v1(84.33,97.09) 81.03,93.79 81.03,85.77 80.85,85.59 78.31,85.59 76.71,87.19 75.7,87.19 75.44,86.93 75.44,85.66 77.69,83.42 77.69,81.15 ; U1.21 v1(94.49,98.11)
  Top Layer w0.254: 58.68,81.09 70.87,81.09 75.44,85.66 ; 58.68,81.09 v1(57.66,80.07) 57.66,76.01 56.14,74.49 56.14,70.42 58.17,68.39 58.17,62.71 57.56,62.1 57.05,62.1 v1(56.55,61.59) ; 58.68,81.09 58.64,81.15 ; 38.51,24 44.86,30.35 44.86,58.54 41.81,61.59 v1(40.29,61.59) 40.1,61.59 39.59,62.1 ; 24.35,81.3 24.63,81.3 35.05,91.72 37.05,91.72 ; 24.35,81.3 20.69,81.3 20.54,81.15 ; 24.35,81.3 24.6,81.05 24.6,66.16 20.54,62.1 ; 39.59,99.59 39.59,96.03 37.05,93.5 37.05,91.72 ; 39.59,99.59 21.15,99.59 20.54,100.2 ; 39.59,99.59 39.59,100.2 ; 40.14,81.34 40.14,88.37 37.3,91.21 37.3,91.46 37.05,91.72 ; 40.14,81.34 v1(40.39,81.34) ; 40.14,81.34 39.78,81.34 39.59,81.15
  Bottom Layer w0.18: v1(94.49,98.11) 85.35,98.11 v1(84.33,97.09)
  Bottom Layer w0.254: v1(57.66,80.07) 41.66,80.07 v1(40.39,81.34) ; v1(40.29,61.59) 40.54,61.85 56.29,61.85 v1(56.55,61.59)
CA2: length 286.3
  Top Layer w0.18: v1(98.95,96.38) 99.71,95.62 99.71,83.68 v1(98.95,82.92) ; 96.74,62.1 96.66,62.17 96.66,68.74 95.81,69.6 95.78,69.6 94.17,71.22 94.17,71.24 93.85,71.56 93.03,71.56 92.46,72.13 92.46,72.95 92.35,73.06 92.35,75.56 v1(94.38,77.59) ; v1(93.87,98.67) 93.87,97.82 U1.22
  Top Layer w0.254: 57.56,24 55.66,25.9 55.66,36.51 57.44,38.29 v1(57.44,41.34) ; 58.71,43.12 v1(73.88,43.12) ; 58.71,43.12 58.71,43.37 v1(58.45,43.63) ; 58.71,43.12 58.64,43.05 ; v1(59.58,61.59) 59.15,61.59 58.64,62.1 ; 39.59,43.05 39.66,43.12 v1(44.23,43.12) ; v1(79.14,61.59) 78.2,61.59 77.69,62.1 ; v1(27.72,43.12) 20.61,43.12 19.52,42.03 19.01,42.03 15.46,45.59 15.46,96.2 19.46,100.2 ; v1(77.69,43.63) 77.69,43.05 ; 20.54,24 20.54,31.62 v1(19.52,32.64) ; v1(82.44,49.65) 82.19,49.9 v1(82.19,62.09) 82.38,62.09 83.14,62.86 96.41,62.86 96.66,62.6
  Bottom Layer w0.18: v1(94.38,77.59) 98.95,82.16 v1(98.95,82.92) ; v1(93.87,98.67) 96.66,98.67 v1(98.95,96.38)
  Bottom Layer w0.254: v1(19.52,32.64) 15.46,36.7 15.46,38.22 16.22,38.99 23.59,38.99 v1(27.72,43.12) v1(44.23,43.12) 57.94,43.12 v1(58.45,43.63) ; v1(59.58,61.59) v1(79.14,61.59) 79.65,62.09 v1(82.19,62.09) ; 57.44,43.12 v1(57.44,41.34) ; v1(73.88,43.12) 74.39,43.63 v1(77.69,43.63) 77.69,44.9 v1(82.44,49.65)
CA3: length 201.3
  Top Layer w0.18: 76.61,62.1 77.36,62.85 77.36,68.04 75.07,70.33 75.07,74.14 76.6,75.66 76.6,77.19 82.69,83.28 82.69,87.6 90.57,95.48 90.57,95.73 92.09,97.25 93.62,97.25 93.87,97 U1.23
  Top Layer w0.254: 39.59,24 40.35,23.24 57.88,23.24 58.64,24 59.15,23.49 v1(59.34,23.49) ; 38.51,100.2 39.12,100.81 81.68,100.81 88.03,94.46 88.03,92.94 ; 77.63,24 77.69,24 78.45,23.24 95.98,23.24 96.74,24 ; 77.63,24 77.63,23.24 76.1,23.24 v1(75.85,23.49) ; 77.63,24 77.63,31.11 74.58,34.16 74.58,36.19 75.34,36.95 75.34,42.8 77.37,44.83 77.37,50.92 75.09,53.21 75.09,55.24 76.61,56.77 76.61,62.1
  Bottom Layer w0.254: v1(75.85,23.49) v1(59.34,23.49)
CA4: length 177.2
  Top Layer w0.18: v1(98.95,95.58) 98.95,83.96 97.44,82.46 97.44,75.29 ; 95.66,62.1 96.16,61.61 96.16,61.55 97.17,61.55 97.44,61.82 97.44,64.17 97.54,64.26 97.54,69.34 100.71,72.52 100.71,74.42 99.82,75.31 97.54,75.31 ; U1.24 93.87,96.6 93.62,96.85 92.6,96.85 v1(92.35,96.6) ; 19.46,81.15 20.92,82.6 21.33,82.6 34.82,96.09 36.72,96.09 v1(37.23,95.58)
  Top Layer w0.254: v1(76.85,25.23) 76.85,24.24 76.61,24 ; v1(75.33,34.37) 75.07,34.62 75.07,36.15 78.38,39.45 78.38,44.53 95.39,61.55 96.16,61.55
  Bottom Layer w0.18: v1(37.23,95.58) 37.74,96.09 91.84,96.09 v1(92.35,96.6) 92.35,96.35 93.11,95.58 v1(98.95,95.58)
  Bottom Layer w0.254: v1(76.85,25.23) 75.33,26.75 v1(75.33,34.37)
CA5: length 196.8
  Top Layer w0.18: 23.51,48.19 24.78,48.19 v1(32.91,40.07) ; v1(81.68,96.71) 81.68,97.98 80.92,98.74 75.9,98.74 62.18,85.02 60.96,85.02 57.66,88.33 48.18,88.33 40.31,80.45 39.21,80.45 38.51,81.15 ; 95.66,24 81.17,38.49 v1(81.17,38.54) ; U1.25 v1(93.36,96.2)
  Top Layer w0.254: 39.26,80.45 37.23,78.42 37.23,75.37 25.54,63.69 25.54,51.24 23.51,49.21 23.51,47.1 19.46,43.05
  Bottom Layer w0.18: v1(32.91,40.07) 33.93,39.05 80.66,39.05 v1(81.17,38.54) ; v1(93.36,96.2) 93.36,96.45 92.6,97.22 86.09,97.22 85.33,96.45 81.93,96.45 v1(81.68,96.71)
CA6: length 104.3
  Top Layer w0.18: 57.56,81.15 58.5,82.08 58.56,82.08 58.82,81.83 62.12,81.83 v1(62.37,82.08) ; v1(83.46,87.16) 91.84,95.55 93.62,95.55 93.87,95.8 U1.26
  Top Layer w0.254: 38.51,43.05 39.01,43.54 39.01,49.57 36.97,51.6 36.97,55.16 37.74,55.92 37.74,62.31 43.07,67.64 43.07,74.46 56.53,87.93 57.55,87.93 58.56,86.91 58.56,82.08
  Bottom Layer w0.18: v1(83.46,87.16) 67.45,87.16 v1(62.37,82.08)
CA7: length 70
  Top Layer w0.18: U1.27 93.87,95.4 93.62,95.15 92.6,95.15 v1(83.46,86) ; 76.61,81.15 76.89,81.43 v1(76.89,82.19)
  Top Layer w0.254: 57.56,43.05 57.56,44.58 62.64,49.65 62.64,67.18 76.61,81.15
  Bottom Layer w0.18: v1(76.89,82.19) 80.7,86 v1(83.46,86)
CA8: length 122
  Top Layer w0.18: 76.61,43.05 76.61,43.45 81.68,48.52 81.68,61.22 80.92,61.98 80.92,63 81.68,63.76 81.68,79.79 94.29,92.41 U1.28
  Top Layer w0.254: 19.46,62.1 20.09,61.47 24.02,61.47 v1(24.78,62.23) ; 80.92,61.98 80.66,62.23 v1(78.63,62.23)
  Bottom Layer w0.254: v1(78.63,62.23) v1(24.78,62.23)
CA9: length 120.6
  Top Layer w0.18: 38.51,62.1 53.52,77.11 55.63,77.11 v1(56.14,76.6) ; v1(82.55,79.39) 82.55,79.9 95,92.35 U1.1
  Top Layer w0.254: v1(36.48,58.29) 35.46,58.29 34.45,57.27 34.45,36.7 20.99,23.24 20.22,23.24 19.46,24 ; 38.51,62.1 v1(38.51,60.07)
  Bottom Layer w0.18: v1(82.55,79.39) 82.3,79.65 59.19,79.65 v1(56.14,76.6)
  Bottom Layer w0.254: v1(36.48,58.29) 38.26,60.07 v1(38.51,60.07)
TEENSY_PIN0: length 111.7
  Bottom Layer w0.254: H1.2 113.41,95 74.05,95 KEY4.1 KEY3.1 KEY2.1 KEY1.1
TEENSY_PIN1: length 119.6
  Top Layer w0.254: v1(98.17,76.2) 98.93,76.2 v1(115.44,92.71) ; v1(116.97,94.23) 116.97,96.01 H1.3
  Bottom Layer w0.254: v1(116.97,94.23) v1(115.44,92.71) ; v1(98.17,76.2) 74.3,76.2 KEY8.1 KEY7.1 KEY6.1 KEY5.1
TEENSY_PIN2: length 147.3
  Bottom Layer w0.254: 92.84,57.15 KEY13.1 ; 92.84,57.15 74.3,57.15 KEY12.1 KEY11.1 KEY10.1 KEY9.1 ; 92.84,57.15 92.84,58.64 92.33,59.15 92.33,74.17 93.6,75.44 115.19,75.44 123.82,84.07 124.33,84.07 125.35,85.09 125.35,99.31 H1.4
TEENSY_PIN3: length 151.6
  Top Layer w0.254: KEY18.1 91.57,39.24 91.57,57.15 92.58,58.17 94.36,58.17 118.75,82.55 v1(118.75,92.71)
  Bottom Layer w0.254: H1.5 v1(118.75,92.71) ; KEY18.1 KEY17.1 KEY16.1 KEY15.1 KEY14.1
TEENSY_PIN4: length 167.3
  Top Layer w0.254: KEY23.1 93.28,18.73 97.92,23.37 97.92,25.15 123.82,51.05 124.33,51.05 125.35,52.07 125.35,94.23 H1.6
  Bottom Layer w0.254: KEY19.1 KEY20.1 KEY21.1 KEY22.1 KEY23.1
TEENSY_PIN5: length 188.9
  Top Layer w0.254: D19.1 18.08,11.94 18.08,28.96 D14.1 18.08,30.48 18.08,40.39 v1(18.84,41.15) ; v1(18.84,43.69) 19.34,44.2 D9.1 17.95,50.17 17.95,55.25 18.46,55.75 D5.1 18.05,68.61 18.05,86.08 D1.1 19.73,86.23 24.04,86.23 v1(29.38,91.57)
  Bottom Layer w0.254: H1.7 120.9,89.79 31.16,89.79 v1(29.38,91.57) ; v1(18.84,43.69) v1(18.84,41.15)
TEENSY_PIN6: length 171.4
  Top Layer w0.254: v1(38.14,78.49) 38.14,75.44 37.12,74.42 37.12,69.34 D6.1 37.25,66.42 37.25,56.13 36.49,55.37 36.49,50.55 D10.1 37.1,47.6 37.1,31.14 D15.1 37.12,28.83 37.12,11.94 D20.1 ; v1(38.14,80.26) 37.38,81.03 37.38,86.23 D2.1
  Bottom Layer w0.254: v1(38.14,78.49) v1(38.14,80.26) 47.28,89.41 123.06,89.41 H1.8
TEENSY_PIN7: length 151.1
  Top Layer w0.254: D21.1 56.17,11.81 56.17,17.15 59.99,20.96 59.99,27.31 56.17,31.12 56.17,36.32 58.21,38.35 58.21,41.4 56.94,42.67 56.94,48.51 57.19,48.77 56.17,49.78 56.17,59.94 55.92,60.2 55.92,66.55 57.19,67.82 55.67,69.34 55.67,74.68 56.94,75.95 56.94,84.07 57.19,84.33 57.19,86.87 D3.1
  Bottom Layer w0.254: H1.9 58.97,87.88 v1(57.19,86.11)
TEENSY_PIN8: length 130.4
  Top Layer w0.254: v1(82.08,85.34) 79.8,83.06 78.53,83.06 ; 76.5,10.79 75.22,12.06 75.22,28.96 D17.1 72.69,33.53 72.69,41.02 76.24,44.58 D12.1 74.72,50.42 74.72,55.5 75.73,56.52 75.73,67.31 D8.1 74.72,69.34 74.72,74.42 76.24,75.95 76.24,78.49 78.53,80.77 78.53,84.07 D4.1
  Bottom Layer w0.254: v1(82.08,85.34) H1.10
TEENSY_PIN9: length 93.3
  Top Layer w0.254: H1.11 120.94,82.8 94.15,56.01 94.15,49.91 D13.1 95.16,37.21 94.15,36.19 94.15,31.5 D18.1 97.45,28.19 97.45,23.62 93.89,20.07 92.62,20.07 91.61,19.05 91.61,14.48 D23.1
TEENSY_PIN14: length 45.6
  Bottom Layer w0.254: H1.36 135.51,73.91 100.46,73.91 99.44,74.93 97.48,74.93 96.2,73.65
TEENSY_PIN18: length 57.8
  Top Layer w0.18: U1.19 95.8,98.62 96.05,98.87 101.9,98.87 v1(107.99,92.77)
  Bottom Layer w0.18: v1(107.99,92.77) 114.6,92.77 123.49,101.66 124.5,101.66 125.77,100.39 129.33,100.39 133.9,95.82 133.9,92.77 138.73,87.95 139.26,87.95 H1.40
TEENSY_PIN19: length 51
  Top Layer w0.18: H1.41 139.26,90.49 132.48,90.49 127.66,95.31 126.13,95.31 124.86,96.58 123.59,96.58 120.55,93.54 116.1,93.54 110.26,99.38 96.16,99.38 95.4,98.62 U1.20
$1N4: length 10.9
  Top Layer w0.254: D1.2 23.17,87.98 KEY1.2
$1N5: length 10.8
  Top Layer w0.254: D2.2 42.22,87.85 KEY2.2
$1N7: length 10.9
  Top Layer w0.254: D3.2 61.27,87.98 KEY3.2
$1N9: length 11.5
  Top Layer w0.254: KEY4.2 80.32,87.22 D4.2
$1N13: length 10.8
  Top Layer w0.254: KEY5.2 23.17,69.69 D5.2
$1N15: length 10.7
  Top Layer w0.254: D6.2 42.22,68.17 KEY6.2
$1N17: length 11
  Top Layer w0.254: D7.2 61.27,68.68 KEY7.2
$1N19: length 11
  Top Layer w0.254: D8.2 80.32,68.68 KEY8.2
$1N21: length 10.9
  Top Layer w0.254: D9.2 23.17,49.37 KEY9.2
$1N23: length 10.9
  Top Layer w0.254: KEY10.2 42.22,49.5 D10.2
$1N25: length 11
  Top Layer w0.254: D11.2 61.27,49.63 KEY11.2
$1N27: length 10.8
  Top Layer w0.254: D12.2 80.32,49.75 KEY12.2
$1N29: length 10.9
  Top Layer w0.254: KEY13.2 99.37,49.88 D13.2
$1N31: length 11.1
  Top Layer w0.254: D14.2 23.17,30.83 KEY14.2
$1N33: length 10.7
  Top Layer w0.254: KEY15.2 42.22,30.7 D15.2
$1N35: length 10.6
  Top Layer w0.254: D16.2 61.27,30.96 KEY16.2
$1N37: length 10.7
  Top Layer w0.254: D17.2 80.32,30.83 KEY17.2
$1N39: length 10.5
  Top Layer w0.254: D18.2 99.37,30.45 KEY18.2
$1N41: length 10.8
  Top Layer w0.254: KEY19.2 23.17,11.53 D19.2
$1N43: length 10.7
  Top Layer w0.254: KEY20.2 42.22,11.78 D20.2
$1N45: length 10.8
  Top Layer w0.254: KEY21.2 61.27,11.91 D21.2
$1N47: length 10.7
  Top Layer w0.254: D22.2 80.32,11.4 KEY22.2
$1N49: length 10.9
  Top Layer w0.254: D23.2 99.37,11.4 KEY23.2
$1N106: length 4.5
  Top Layer w0.18: R2.2 97.25,90.3 97.25,93.62 97,93.87 U1.6

## Text on the board
Top Silkscreen Layer: NOTE | PATTERN | SHIFT | MUTE | PLAY/STOP | BANK | CLEAR
